# Altium schematic sheet LSM6DSO.SchDoc
size A4; SheetNumber: 3; SheetTotal: 9
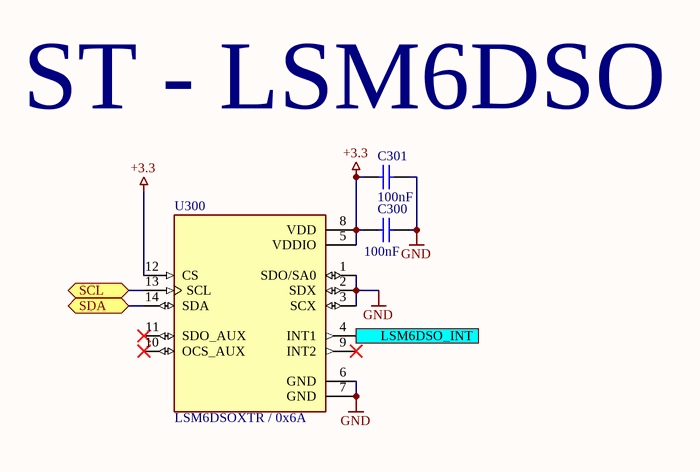
[diagram p0: LSM6DSO.SchDoc]

## Parts
C300  value 100nF  [0603]  (hidden comment: 0603)
C301  value 100nF  [0603]  (hidden comment: 0603)
U300  LSM6DSOXTR / 0x6A  [PQFN50P250X300X86-14N]

## Ports
LSM6DSO_INT (out, see Raspberry_PI5[3B]), SCL (bidir, see BNO085[2C], PCA9685[2B], Raspberry_PI5[2B], Test_Sensor_Connectoren[1D], Test_Sensor_Connectoren[2D]), SDA (bidir, see BNO085[2C], PCA9685[2B], Raspberry_PI5[2B], Test_Sensor_Connectoren[1C], Test_Sensor_Connectoren[2D])

## Nets
+3.3: C300.1 C301.1 U300.5(VDDIO) U300.8(VDD) U300.12(CS)
GND: C300.2 C301.2 U300.1(SDO/SA0) U300.2(SDX) U300.3(SCX) U300.6(GND) U300.7(GND)
LSM6DSO_INT: U300.4(INT1) ; port LSM6DSO_INT
SCL: U300.13(SCL) ; port SCL
SDA: U300.14(SDA) ; port SDA

Not connected (* = marked no-connect by the designer): U300 9(INT2)* 10(OCS_AUX)* 11(SDO_AUX)*

## Notes on the sheet
- (near C301) ST - LSM6DSO

## Library data of the parts
C300 C301 = KO: Kondensator
U300 = LSM6DSOXTR: Accelerometer, Gyroscope, 6 Axis Sensor I2C, SPI Output; MF: STMicroelectronics; SnapEDA_Link: https://www.snapeda.com/parts/LSM6DSOXTR/STMicroelectronics/view-part/?ref=snap; Package: VFLGA-14 STMicroelectronics; Value: *; MP: LSM6DSOXTR; Check_prices: https://www.snapeda.com/parts/LSM6DSOXTR/STMicroelectronics/view-part/?ref=eda